# Altium project PCB.SCHEMATIC.BMS.PrjPcb
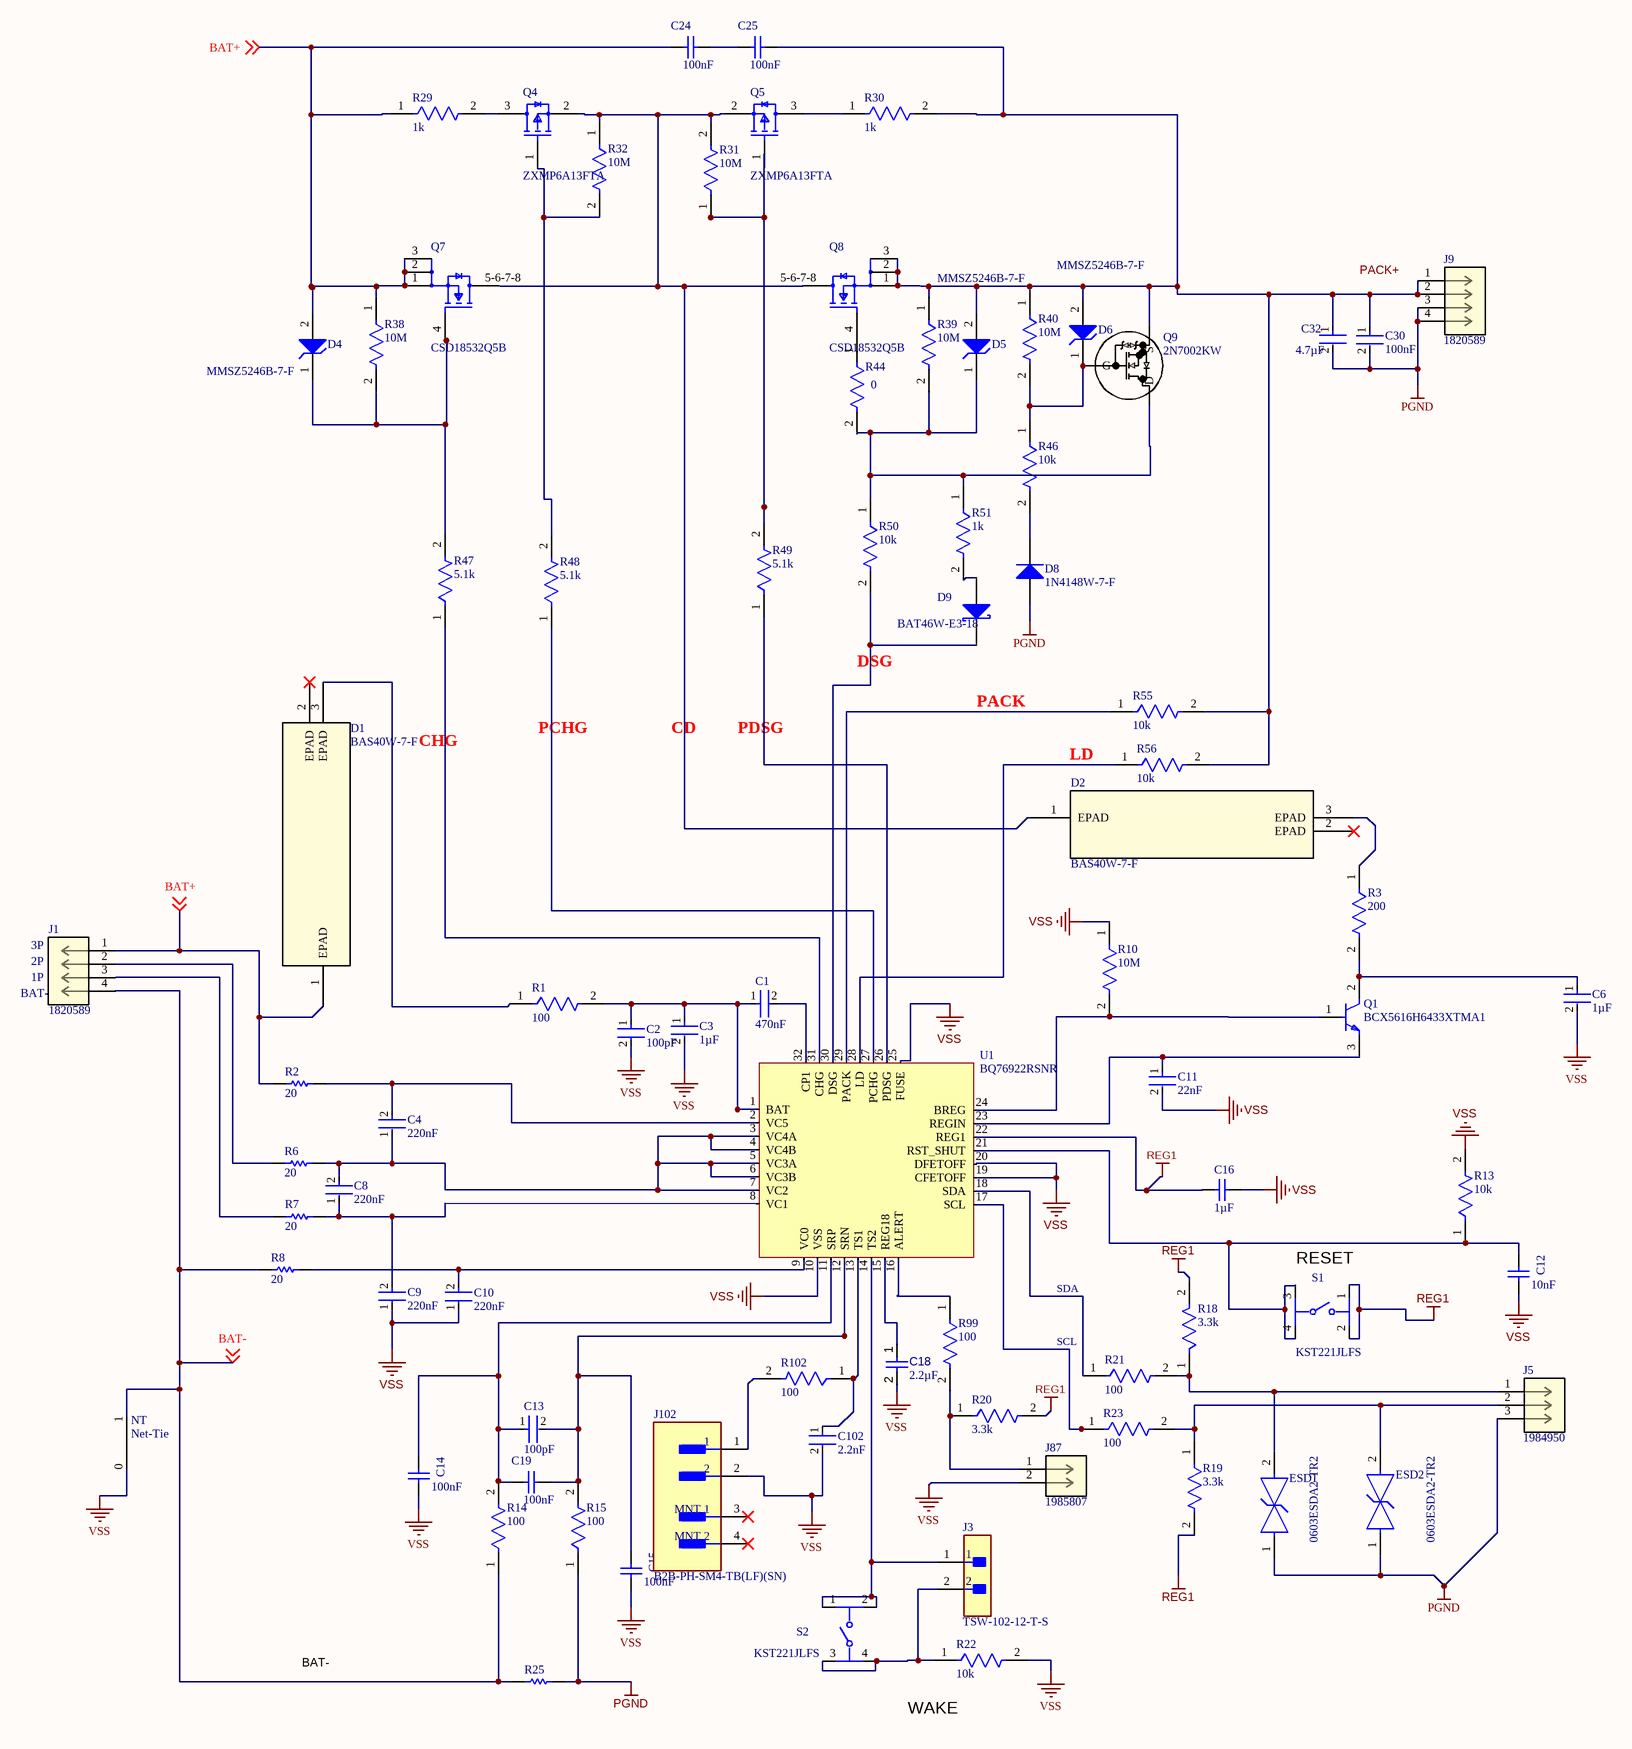
[diagram p0: BMS.SchDoc]
1 sheet, 81 parts. Net scope: global (net labels, ports and power ports of the same name join across sheets).
Board file: BMS_PCB.PcbDoc

## Sheet BMS.SchDoc
size A0; SheetNumber: 1; SheetTotal: 1

### Parts
C1  value 470nF  [FP-GCM219-0_15-MFG]  (hidden comment: GCM219R71E474KA55D)
C2  value 100pF  [FP-C0603C-CF-MFG]  (hidden comment: C0603C101J5GACTU)
C3  value 1µF  [FP-CGA5L-0_3-0_1-MFG]  (hidden comment: CGA5L3X7R1H105K160AB)
C4  value 220nF  [FP-C1608-080-0_1-MFG]  (hidden comment: C1608X7R1H224K080AB)
C6  value 1µF  [FP-CGA5L-0_3-0_1-MFG]  (hidden comment: CGA5L3X7R1H105K160AB)
C8  value 220nF  [FP-C1608-080-0_1-MFG]  (hidden comment: C1608X7R1H224K080AB)
C9  value 220nF  [FP-C1608-080-0_1-MFG]  (hidden comment: C1608X7R1H224K080AB)
C10  value 220nF  [FP-C1608-080-0_1-MFG]  (hidden comment: C1608X7R1H224K080AB)
C11  value 22nF  [FP-C0603C-CF-MFG]  (hidden comment: C0603C223K4RACTU)
C12  value 10nF  [WCAP-CSGP_0603_L1.6W0.8H0.8_Reflow]  (hidden comment: 885012206040)
C13  value 100pF  [FP-C0603C-CF-IPC_A]  (hidden comment: C0603C101J5GACTU)
C14  value 100nF  [WCAP-CSGP_0603_L1.6W0.8H0.8_Reflow]  (hidden comment: 885012206095)
C15  value 100nF  [WCAP-CSGP_0603_L1.6W0.8H0.8_Reflow]  (hidden comment: 885012206095)
C16  value 1µF  [CAPC2013X135X45ML10T25]  (hidden comment: GRM21BR71C105KA01L)
C18  value 2.2µF  [FP-C2012-125-0_2-MFG]  (hidden comment: C2012X7R1C225K125AB)
C19  value 100nF  [WCAP-CSGP_0603_L1.6W0.8H0.8_Reflow]  (hidden comment: 885012206095)
C24  value 100nF  [WCAP-CSGP_0603_L1.6W0.8H0.8_Reflow]  (hidden comment: 885012206095)
C25  value 100nF  [WCAP-CSGP_0603_L1.6W0.8H0.8_Reflow]  (hidden comment: 885012206095)
C30  value 100nF  [FP-C0805C-DN-MFG]  (hidden comment: C0805C104K5RACTU)
C32  value 4.7µF  [FP-GRM21B-0_2-e0_2_0_7-MFG]  (hidden comment: GRM21BZ71E475KE15L)
C102  value 2.2nF  [FP-C0805C-DN-MFG]  (hidden comment: C0805C222K5RACTU)
D1  BAS40W-7-F  [SOT-323_DIO]
D2  BAS40W-7-F  [SOT-323_DIO]
D4  MMSZ5246B-7-F  [ONSC-SOD-123-2-425-04_V]
D5  MMSZ5246B-7-F  [ONSC-SOD-123-2-425-04_V]
D6  MMSZ5246B-7-F  [ONSC-SOD-123-2-425-04_V]
D8  1N4148W-7-F  [DIOD-SOD123-2_V]
D9  BAT46W-E3-18  [DIOD-SOD-123-2_V]
ESD1  0603ESDA2-TR2  [FP-PESD0603-MFG]
ESD2  0603ESDA2-TR2  [FP-PESD0603-MFG]
J1  1820589  [CONN_1751264_PXC]
J3  TSW-102-12-T-S  [FP-TSW-102-12-T-S-MFG]
J5  1984950  [CONN_1751251_PXC]
J9  1820589  [CONN_1751264_PXC]
J87  1985807  [CONN_1751248_PXC]
J102  B2B-PH-SM4-TB(LF)(SN)  [FP-B2B-PH-SM4-TB_LF_SN-MFG]
NT  Net-Tie  [Net-Tie-Footprint-1]  (net tie, no BOM)
Q1  BCX5616H6433XTMA1  [FP-SOT89-MFG]
Q4  ZXMP6A13FTA  [FP-SOT23-MFG]
Q5  ZXMP6A13FTA  [FP-SOT23-MFG]
Q7  CSD18532Q5B  [FP-DNK0008A-MFG]
Q8  CSD18532Q5B  [FP-DNK0008A-MFG]
Q9  2N7002KW  [SC-70_419AB-01_OSI]
R1  value 100  [FP-CRCW0603-e3-MFG]  (hidden comment: CRCW0603100RJNEA)
R2  value 20  [RESC3216X60X45ML10T20]  (hidden comment: CRCW120620R0FKEA)
R3  value 200  [FP-CRCW2512-e3-MFG]  (hidden comment: CRCW2512200RJNEG)
R6  value 20  [RESC3216X60X45ML10T20]  (hidden comment: CRCW120620R0FKEA)
R7  value 20  [RESC3216X60X45ML10T20]  (hidden comment: CRCW120620R0FKEA)
R8  value 20  [RESC3216X60X45ML10T20]  (hidden comment: CRCW120620R0FKEA)
R10  value 10M  [FP-CRCW0603-e3-MFG]  (hidden comment: CRCW060310M0JNEA)
R13  value 10k  [FP-CRCW0805-e3-MFG]  (hidden comment: CRCW080510K0FKEA)
R14  value 100  [FP-CRCW0603-e3-MFG]  (hidden comment: CRCW0603100RJNEA)
R15  value 100  [FP-CRCW0603-e3-MFG]  (hidden comment: CRCW0603100RJNEA)
R18  value 3.3k  [FP-AC0805-IPC_B]  (hidden comment: AC0805JR-073K3L)
R19  value 3.3k  [FP-AC0805-IPC_B]  (hidden comment: AC0805JR-073K3L)
R20  value 3.3k  [FP-AC0805-IPC_B]  (hidden comment: AC0805JR-073K3L)
R21  value 100  [FP-CRCW0603-e3-MFG]  (hidden comment: CRCW0603100RJNEA)
R22  value 10k  [FP-CRCW0805-e3-MFG]  (hidden comment: CRCW080510K0FKEA)
R23  value 100  [FP-CRCW0603-e3-MFG]  (hidden comment: CRCW0603100RJNEA)
R25  PMR25HZPFV1L00  [RESC3225X70X50ML20T20]  (value not drawn)
R29  value 1k  [FP-CRCW2512-e3-MFG]  (hidden comment: CRCW25121K00JNEG)
R30  value 1k  [FP-CRCW2512-e3-MFG]  (hidden comment: CRCW25121K00JNEG)
R31  value 10M  [FP-CRCW0603-e3-MFG]  (hidden comment: CRCW060310M0JNEA)
R32  value 10M  [FP-CRCW0603-e3-MFG]  (hidden comment: CRCW060310M0JNEA)
R38  value 10M  [FP-CRCW0603-e3-MFG]  (hidden comment: CRCW060310M0JNEA)
R39  value 10M  [FP-CRCW0603-e3-MFG]  (hidden comment: CRCW060310M0JNEA)
R40  value 10M  [FP-CRCW0603-e3-MFG]  (hidden comment: CRCW060310M0JNEA)
R44  value 0  [FP-CRCW0603-HPe3-MFG]  (hidden comment: CRCW06030000Z0EAHP)
R46  value 10k  [FP-CRCW0805-e3-MFG]  (hidden comment: CRCW080510K0FKEA)
R47  value 5.1k  [FP-CRCW0603-e3-MFG]  (hidden comment: CRCW06035K10JNEA)
R48  value 5.1k  [FP-CRCW0603-e3-MFG]  (hidden comment: CRCW06035K10JNEA)
R49  value 5.1k  [FP-CRCW0603-e3-MFG]  (hidden comment: CRCW06035K10JNEA)
R50  value 10k  [FP-CRCW0805-e3-MFG]  (hidden comment: CRCW080510K0FKEA)
R51  value 1k  [FP-CRCW0603-e3-MFG]  (hidden comment: CRCW06031K00JNEA)
R55  value 10k  [FP-CRCW0805-e3-MFG]  (hidden comment: CRCW080510K0FKEA)
R56  value 10k  [FP-CRCW0805-e3-MFG]  (hidden comment: CRCW080510K0FKEA)
R99  value 100  [FP-CRCW0603-e3-MFG]  (hidden comment: CRCW0603100RJNEA)
R102  value 100  [FP-CRCW0603-e3-MFG]  (hidden comment: CRCW0603100RJNEA)
S1  KST221JLFS  [FP-KSC2_TE_01J_LFS-MFG]
S2  KST221JLFS  [FP-KSC2_TE_01J_LFS-MFG]
U1  BQ76922RSNR  [QFN32_RSN_TEX]

### Nets
PGND: C30.2 C32.2 D8.1(A) ESD1.1 ESD2.1 J5.3 J9.3 J9.4 R15.1 R25.2
REG1: C16.1 R18.2 R19.2 R20.2 S1.1 S1.2 U1.22(REG1)
VSS: C2.2 C3.2 C6.2 C9.1 C10.1 C11.2 C12.2 C14.2 C15.2 C16.2 C18.2 C102.2 J87.2 J102.2 NT.0 R10.1 R13.2 R22.2 U1.10(VSS) U1.19(CFETOFF) U1.20(DFETOFF) U1.25(FUSE)
 BAT+: C24.1 D1.1(EPAD) D4.2(A) J1.1 Q7.1(S) Q7.2(S) Q7.3(S) R2.1 R29.1 R38.1 ; off-sheet BAT+, off-sheet  BAT+  [also labelled BAT+]
BAT-: J1.4 NT.1 R8.1 R14.1 R25.1 ; off-sheet BAT-
NetC1_1: C1.1 C2.1 C3.1 R1.2 U1.1(BAT)
NetC1_2: C1.2 U1.32(CP1)
NetC4_1: C4.1 C8.2 R6.2 U1.3(VC4A) U1.4(VC4B) U1.5(VC3A) U1.6(VC3B) U1.7(VC2)
NetC4_2: C4.2 R2.2 U1.2(VC5)
NetC6_1: C6.1 Q1.2(C) R3.2
NetC8_1: C8.1 C9.2 R7.2 U1.8(VC1)
NetC10_2: C10.2 R8.2 U1.9(VC0)
NetC11_1: C11.1 Q1.3(E) U1.23(REGIN)
NetC12_1: C12.1 R13.1 S1.3 S1.4 U1.21(RST_SHUT)
NetC13_1: C13.1 C14.1 C19.1 R14.2 U1.11(SRP)
NetC13_2: C13.2 C15.1 C19.2 R15.2 U1.12(SRN)
NetC18_1: C18.1 U1.15(REG18)
NetC24_2: C24.2 C25.1
NetC25_2: C25.2 C30.1 C32.1 D5.2(A) D6.2(A) J9.1 J9.2 Q8.1(S) Q8.2(S) Q8.3(S) Q9.2(S) R30.2 R39.1 R40.1 R55.2 R56.2
NetC102_1: C102.1 R102.1 U1.13(TS1)
NetD1_3: D1.3(EPAD) R1.1
NetD2_1: D2.1(EPAD) Q4.2(S) Q5.2(S) Q7.5-6-7-8(D) Q8.5-6-7-8(D) R31.2 R32.1
NetD2_3: D2.3(EPAD) R3.1
NetD4_1: D4.1(K) Q7.4(G) R38.2 R47.2
NetD5_1: D5.1(K) Q9.3(D) R39.2 R44.2 R50.1 R51.1
NetD6_1: D6.1(K) Q9.1(G) R40.2 R46.1
NetD8_2: D8.2(K) R46.2
NetD9_1: D9.1(A) R51.2
NetD9_2: D9.2(K) R50.2 U1.30(DSG)
NetESD1_2: ESD1.2 J5.1 R18.1 R21.2
NetESD2_2: ESD2.2 J5.2 R19.1 R23.2
NetJ1_2: J1.2 R6.1
NetJ1_3: J1.3 R7.1
NetJ3_1: J3.1 S2.1 S2.2 U1.14(TS2)
NetJ3_2: J3.2 R22.1 S2.3 S2.4
NetJ87_1: J87.1 R20.1 R99.2
NetJ102_1: J102.1 R102.2
NetQ1_1: Q1.1(B) R10.2 U1.24(BREG)
NetQ4_1: Q4.1(G) R32.2 R48.2
NetQ4_3: Q4.3(D) R29.2
NetQ5_1: Q5.1(G) R31.1 R49.2
NetQ5_3: Q5.3(D) R30.1
NetQ8_4: Q8.4(G) R44.1
NetR21_1: R21.1 U1.18(SDA)
NetR23_1: R23.1 U1.17(SCL)
NetR47_1: R47.1 U1.31(CHG)
NetR48_1: R48.1 U1.27(PCHG)
NetR49_1: R49.1 U1.26(PDSG)
NetR55_1: R55.1 U1.29(PACK)
NetR56_1: R56.1 U1.28(LD)
NetR99_1: R99.1 U1.16(ALERT)

Not connected (* = marked no-connect by the designer): D1 2(EPAD)*; D2 2(EPAD)*; J102 3(MNT_1)* 4(MNT_2)*

### Notes on the sheet
- DSG
- CHG
- PCHG
- CD
- PDSG
- PACK
- LD
- (near J1) 3P
- (near J1) BAT-
- (near J1) 2P
- (near J1) 1P
- (near S1) RESET
- SDA
- (near R21) SCL
- BAT-
- WAKE
- Labels drawn without touching a wire or pin: PACK+

### Library data of the parts
C1 = CMP-001-00095-1: 25V 470nF X7R ±10% 0805 Multilayer Ceramic Capacitors MLCC - SMD/SMT ROHS; Tolerance: 10%; Max Operating Temperature: 125°C; Voltage Rating: 25V; Min Operating Temperature: -55°C; Case/Package: 0805; Mounting Technology: Surface Mount
C2 C13 = CMP-001-00094-1: Multilayer Ceramic Capacitors MLCC - SMD/SMT 50V 100pF C0G 0603 5%; Min Operating Temperature: -55°C; Tolerance: 5%; Voltage Rating: 50V; Mounting Technology: Surface Mount; Case/Package: 0603; Max Operating Temperature: 125°C; Pins: 2
C3 C6 = CMP-001-00096-1: CGA Series 1206 1 uF 50 V ±10 % Tolerance X7R SMT Multilayer Ceramic Capacitor; Tolerance: 10%; Voltage Rating: 50V; Max Operating Temperature: 125°C; Case/Package: 1206; Min Operating Temperature: -55°C; Mounting Technology: Surface Mount
C4 C8-C10 = CMP-001-00097-1: 50V 220nF X7R 卤10% 0603 Multilayer Ceramic Capacitors MLCC - SMD/SMT ROHS; Tolerance: 10%; Voltage Rating: 50V; Pins: 2; Mounting Technology: Surface Mount; Case/Package: 0603; Min Operating Temperature: -55°C; Max Operating Temperature: 125°C
C11 = CMP-001-00088-1: Multilayer Ceramic Capacitors MLCC - SMD/SMT 16V 0.022uF X7R 0603 10%; Voltage Rating: 16V; Mounting Technology: Surface Mount; Pins: 2; Tolerance: 10%; Case/Package: 0603; Max Operating Temperature: 125°C; Min Operating Temperature: -55°C
C12 = CMP-001-00091-1: Capacitor 10NF Multilayer Ceramic Mlcc 16 V , X7R Dielectric 0603 Surface Mount; Voltage Rating: 16V; Tolerance: 10%; Max Operating Temperature: 125°C; Mounting Technology: Surface Mount; Case/Package: 0603; Min Operating Temperature: -55°C
C14 C15 C19 C24 C25 = CMP-001-00099-1: Ceramic Capacitor, Multilayer, Ceramic, 50V, 10% +Tol, 10% -Tol, X7R, 15% TC, 0.1uF, Surface Mount, 0603; Voltage Rating: 50V; Min Operating Temperature: -55°C; Mounting Technology: Surface Mount; Case/Package: 0603; Tolerance: 10%; Max Operating Temperature: 125°C
C16 = CMP-001-00090-1: 0805 1 uF 16 V ±10% Tolerance X7R SMT Multilayer Ceramic Capacitor; Voltage Rating: 16V; Case/Package: 0805; Min Operating Temperature: -55°C; Mounting Technology: Surface Mount; Pins: 2; Max Operating Temperature: 125°C; Tolerance: 10%
C18 = CMP-001-00092-1: C Series 0805 2.2 uF 16 V ±10 % Tolerance X7R SMT Multilayer Ceramic Capacitor; Voltage Rating: 16V; Tolerance: 10%; Max Operating Temperature: 125°C; Pins: 2; Min Operating Temperature: -55°C; Case/Package: 0805; Mounting Technology: Surface Mount
C30 = CMP-001-00089-1: 50V 100nF X7R ±10% 0805 Multilayer Ceramic Capacitors MLCC - SMD/SMT ROHS; Tolerance: 10%; Case/Package: 0805; Mounting Technology: Surface Mount; Max Operating Temperature: 125°C; Pins: 2; Min Operating Temperature: -55°C; Voltage Rating: 50V
C32 = CMP-001-00100-1: 25V 4.7uF X7R ±10% 0805 Multilayer Ceramic Capacitors MLCC - SMD/SMT ROHS; Min Operating Temperature: -55°C; Mounting Technology: Surface Mount; Max Operating Temperature: 125°C; Tolerance: 10%; Voltage Rating: 25V; Case/Package: 0805
C102 = CMP-001-00087-1: Multilayer Ceramic Capacitors MLCC - SMD/SMT 50V 2200pF X7R 0805 10%; Mounting Technology: Surface Mount; Tolerance: 10%; Min Operating Temperature: -55°C; Max Operating Temperature: 125°C; Pins: 2; Case/Package: 0805; Voltage Rating: 50V
D1 D2 = BAS40W-7-F: No Description Available; Manufacturer_Name: Diodes Inc; Copyright: Copyright (C) 2026 Ultra Librarian. All rights reserved.; Manufacturer_Part_Number: BAS40W-7-F; RefDes: RefDes; Type: Type
D4-D6 = CMP-004-00037-1: Zener Diode Single 16V 5% 17Ohm 500mW 2-Pin SOD-123 T/R / DIODE ZENER 16V 500MW SOD123; Forward Voltage: 900mV; Min Operating Temperature: -55°C; Pins: 2; Max Operating Temperature: 150°C; Case/Package: SOD-123-2
D8 = CMP-004-00035-1: Small Signal Diode, Single, 100 V, 300 Ma, 1.25 V, 4 Ns, 2 A Rohs Compliant: Yes; Forward Voltage: 715mV; Max Surge Current: 2A; Forward Current: 300mA; Pins: 2; Min Operating Temperature: -65°C; Max Operating Temperature: 150°C; Mounting Technology: Surface Mount
D9 = CMP-004-00033-1: Rectifier Diode, Schottky, 1 Phase, 1 Element, 0.15A, 100V V(RRM), Silicon; Forward Voltage: 250mV; Forward Current: 150mA; Min Operating Temperature: -55°C; Pins: 2; Max Operating Temperature: 150°C
ESD1 ESD2 = CMP-004-00042-1: ESD protection diodes / TVS diodes; LITTELFUSE; PESD0603-240; 45 V; 24 V; Case/Package: 0603; Mounting Technology: Surface Mount; Max Operating Temperature: 125°C; Min Operating Temperature: -55°C
J1 J9 = 1820589: PCB terminal block, nominal current: 13.5 A, nom. voltage: 200 V, pitch: 3.5 mm, number of positions: 4, connection method: Screw connection with tension sleeve, mounting: THR soldering, conductor/PCB connection direction: 0 Â°, color: black; Manufacturer_Name: Phoenix Contact; Copyright: Copyright (C) 2026 Ultra Librarian. All rights reserved.; Manufacturer_Part_Number: 1820589; RefDes: RefDes; Type: Type
J3 = CMP-00030-00002-1: Pin Header, Board-to-Board, 2.54 mm, 1 Rows, 2 Contacts, Through Hole, TSW Series; Manufacturer Lifecycle Status: PRODUCTION; Pitch: 2.54mm; Gender: Male; Current Rating: 6.3A; Voltage Rating: 550V; Number of Contacts: 2; Height: 8.71mm; Radiation Hardening: No; Mounting Technology: Through Hole; Contact Plating: Tin; Number of Rows: 1; REACH SVHC: No; RoHS: Compliant; Min Operating Temperature: -55°C; Lifecycle Status: Production; Contact Material: Nickel, Tin; Lead Pitch: 2.54mm; Max Operating Temperature: 105°C; Termination: Solder; Packaging: Bulk
J5 = 1984950: PCB terminal block, nominal current: 13.5 A, rated voltage (III/2): 200 V, nominal cross section: 1.5 mmÂ², number of potentials: 3, Number of rows: 1, Number of positions per row: 3, product range: MKDS 1/..-HT, pitch: 3.5 mm, connection method: Screw con; Manufacturer_Name: Phoenix Contact; Copyright: Copyright (C) 2026 Ultra Librarian. All rights reserved.; Manufacturer_Part_Number: 1984950; RefDes: RefDes; Type: Type
J87 = 1985807: PCB terminal block, nominal current: 13.5 A, nom. voltage: 200 V, pitch: 3.5 mm, number of positions: 2, connection method: Screw connection with tension sleeve, mounting: THR soldering, conductor/PCB connection direction: 0 Â°, color: black. This article can be soldered in the reflow furnace together with SMD components.; Manufacturer_Name: Phoenix Contact; Copyright: Copyright (C) 2026 Ultra Librarian. All rights reserved.; Manufacturer_Part_Number: 1985807; RefDes: RefDes; Type: Type
J102 = CMP-00030-00010-1: Connector Header, PH Series, 2 Position, 2.00mm, 100V, Surface Mount, Solder, Natural; Max Operating Temperature: 85°C; Min Operating Temperature: -25°C; Pins: 2; Mounting Technology: Surface Mount
NT = CMP-00001-2
Q1 = CMP-013-00035-1: Bipolar (BJT) Single Transistor, NPN, 80 V, 1 A, 2 W, SOT-89, Surface Mount; Frequency: 150MHz; Min Operating Temperature: -65°C; Mounting Technology: Surface Mount; Case/Package: SOT-89; Max Operating Temperature: 150°C; Pins: 4
Q4 Q5 = CMP-004-00036-1: Trans Mosfet P-ch 60V 1.1A 3-PIN SOT-23 T/r / Mosfet P-ch 60V 0.9A SOT23-3; Mounting Technology: Surface Mount; Max Operating Temperature: 150°C; Pins: 3; Case/Package: SOT-23; Min Operating Temperature: -55°C
Q7 Q8 = CMP-031-00010-1: 60-V, N channel NexFET™ power MOSFET, single SON 5 mm x 6 mm, 3.2 mOhm 8-VSON-CLIP -55 to 150; Max Operating Temperature: 150°C; Min Operating Temperature: -55°C; Pins: 8; Mounting Technology: Surface Mount
Q9 = 2N7002KW: Description; Manufacturer_Name: onsemi; Copyright: Copyright (C) 2026 Ultra Librarian. All rights reserved.; Manufacturer_Part_Number: 2N7002KW
R1 R14 R15 R21 R23 R99 R102 = CMP-009-00188-1: 100mW Thick Film Resistors 75V ±5% ±200ppm/℃ 100Ω 0603 Chip Resistor - Surface Mount ROHS; Max Operating Temperature: 155°C; Voltage Rating: 75V; Tolerance: 5%; Mounting Technology: Surface Mount; Case/Package: 0603; Pins: 2; Min Operating Temperature: -55°C
R2 R6-R8 = CMP-009-00189-1: Fixed Resistor, Metal Glaze/thick Film, 0.25W, 20ohm, 200V, 1% +/-Tol, Surface Mount, 1206; Voltage Rating: 200V; Tolerance: 1%; Pins: 2; Min Operating Temperature: -55°C; Mounting Technology: Surface Mount; Case/Package: 1206; Max Operating Temperature: 155°C
R3 = CMP-009-00185-1: Fixed Resistor, Metal Glaze/thick Film, 1W, 200ohm, 500V, 5% +/-Tol, Surface Mount, 2512; Max Operating Temperature: 155°C; Pins: 2; Min Operating Temperature: -55°C; Voltage Rating: 500V; Tolerance: 5%; Case/Package: 2512; Mounting Technology: Surface Mount
R10 R31 R32 R38-R40 = CMP-009-00184-1: 100mW Thick Film Resistors 75V ±5% ±200ppm/℃ 10MΩ 0603 Chip Resistor - Surface Mount ROHS; Pins: 2; Min Operating Temperature: -55°C; Tolerance: 5%; Max Operating Temperature: 155°C; Case/Package: 0603; Voltage Rating: 75V; Mounting Technology: Surface Mount
R13 R22 R46 R50 R55 R56 = CMP-009-00186-1: Res Thick Film 0805 10K Ohm 1% 0.125W(1/8W) ±100ppm/C Pad SMD Automotive T/R; Voltage Rating: 150V; Max Operating Temperature: 155°C; Pins: 2; Case/Package: 0805; Min Operating Temperature: -55°C; Tolerance: 1%; Mounting Technology: Surface Mount
R18-R20 = CMP-009-00178-1: Res Thick Film 0805 3.3K Ohm 5% 0.125W(1/8W) ±100ppm/C Pad SMD T/R Automotive AEC-Q200; Voltage Rating: 150V; Case/Package: 0805; Max Operating Temperature: 155°C; Mounting Technology: Surface Mount; Min Operating Temperature: -55°C; Tolerance: 5%
R25 = CMP-009-00196-1: Current Sense Resistors - SMD 1210 0.001ohm 1% AEC-Q200; Min Operating Temperature: -55°C; Max Operating Temperature: 155°C; Case/Package: 1210; Tolerance: 1%; Mounting Technology: Surface Mount; Pins: 2
R29 R30 = CMP-009-00193-1: Fixed Resistor, Metal Glaze/thick Film, 1W, 1000ohm, 500V, 5% +/-Tol, Surface Mount, 2512; Case/Package: 2512; Voltage Rating: 500V; Mounting Technology: Surface Mount; Tolerance: 5%; Min Operating Temperature: -55°C; Pins: 2; Max Operating Temperature: 155°C
R44 = CMP-009-00192-1: 333.333mW Thick Film Resistors 75V 0Ω 0603 Chip Resistor - Surface Mount ROHS; Case/Package: 0603; Max Operating Temperature: 155°C; Pins: 2; Voltage Rating: 75V; Mounting Technology: Surface Mount; Min Operating Temperature: -55°C
R47-R49 = CMP-009-00194-1: Fixed Resistor, Metal Glaze/thick Film, 0.1W, 5100ohm, 75V, 5% +/-Tol, Surface Mount, 0603; Pins: 2; Case/Package: 0603; Voltage Rating: 75V; Min Operating Temperature: -55°C; Max Operating Temperature: 155°C; Tolerance: 5%; Mounting Technology: Surface Mount
R51 = CMP-009-00191-1: Res Thick Film 0603 1K Ohm 5% 1/10W ±200ppm/°C Molded SMD SMD Paper T/R; Voltage Rating: 75V; Min Operating Temperature: -55°C; Max Operating Temperature: 155°C; Mounting Technology: Surface Mount; Pins: 2; Tolerance: 5%; Case/Package: 0603
S1 S2 = CMP-00030-00006-2: Tactile Switch, 0.003A, 24Vdc, 160Gf/Smd Rohs Compliant: Yes; Min Operating Temperature: -40°C; Mounting Technology: Surface Mount; Max Operating Temperature: 90°C
U1 = CMP-00000-2: Three-series to five-series cell lithium-ion and lithium-phosphate battery monitor 32-QFN -40 to 85; Manufacturer Lifecycle Status: ACTIVE; Pins: 32; RoHS: Compliant; Thickness: 750µm; Length: 4mm; Height: 800µm; Width: 4mm; Lifecycle Status: Production